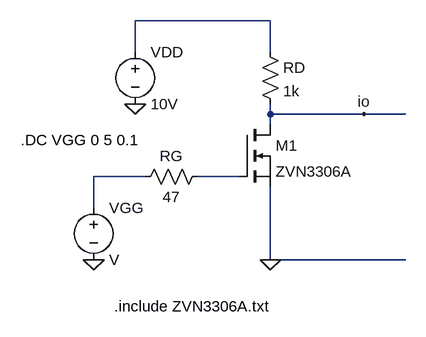
[diagram p0: schematic Mosfet.asc]
Mosfet.asc, the LTspice schematic file:
Version 4
SHEET 1 880 680
WIRE 112 128 -96 128
WIRE -96 176 -96 128
WIRE 112 176 112 128
WIRE 112 272 112 256
WIRE 256 272 112 272
WIRE 320 272 256 272
WIRE 112 288 112 272
WIRE -80 368 -160 368
WIRE 64 368 0 368
WIRE -160 416 -160 368
WIRE 112 496 112 384
WIRE 320 496 112 496
FLAG -160 496 0
FLAG 112 496 0
FLAG -96 256 0
FLAG 256 272 io
SYMBOL voltage -160 400 R0
SYMATTR InstName VGG
SYMBOL voltage -96 160 R0
SYMATTR InstName VDD
SYMATTR Value 10V
SYMBOL res 96 160 R0
SYMATTR InstName RD
SYMATTR Value 1k
SYMBOL res 16 352 R90
WINDOW 0 0 56 VBottom 2
WINDOW 3 32 56 VTop 2
SYMATTR InstName RG
SYMATTR Value 47
SYMBOL nmos 64 288 R0
SYMATTR InstName M1
SYMATTR Value ZVN3306A
SYMATTR Prefix X
TEXT -272 312 Left 2 !.DC VGG 0 5 0.1
TEXT -128 568 Left 2 !.include ZVN3306A.txt

The netlist it stands for:
* Mosfet.asc
VGG N002 0 V
VDD N001 0 10V
RD N001 io 1k
RG N003 N002 47
XM1 io N003 0 ZVN3306A  ; pins D G S
.DC VGG 0 5 0.1
.include ZVN3306A.txt
.backanno
.end